# Altium schematic sheet Interface_Debug.SchDoc: Interface - USB-C and SWD Debug
size A3; ApprovedBy: Weymen Koo; CheckedBy: -; DrawnBy: Weymen Koo; DocumentNumber: UBCAD-FCSOM-SCH; Revision: A; SheetNumber: 15; SheetTotal: 18; ProjectTitle: Flight Controller SoM; Status: PRELIMINARY; ReleaseDate: 2026-11-14
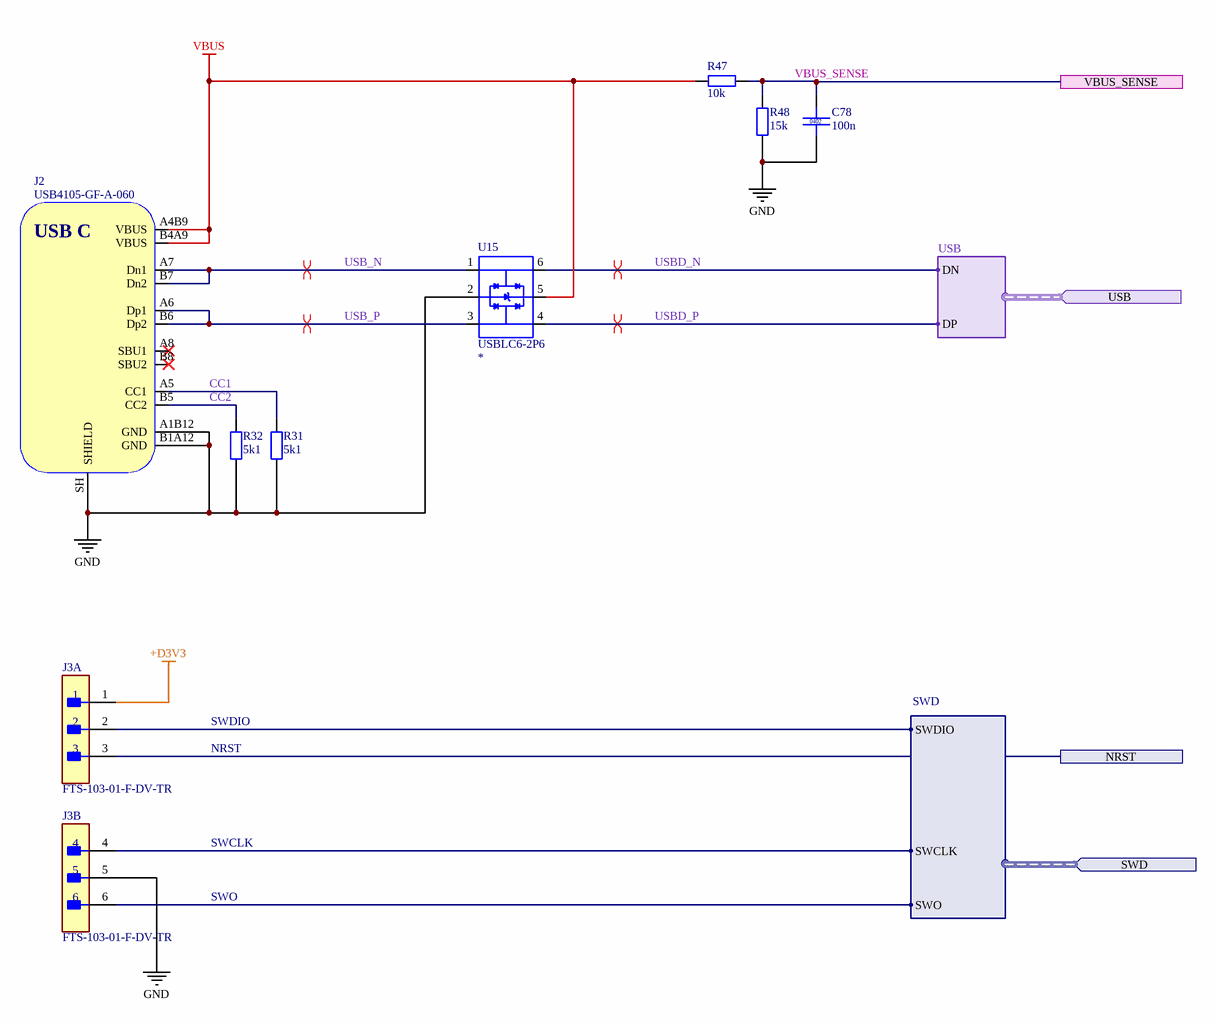
[diagram p0: Interface_Debug.SchDoc]

## Parts
C78  100n  [CAPC1005X05N]
J2  USB4105-GF-A-060  [USB4105-GF-A-060]
J3  FTS-103-01-F-DV-TR  [FP-FTS-103-01-F-DV-TR-MFG]  (parts A,B of 2)
R31  5k1  [IPC C R0402 NO SILK]
R32  5k1  [IPC C R0402 NO SILK]
R47  10k  [IPC C R0402 NO SILK]
R48  15k  [IPC C R0402 NO SILK]
U15  USBLC6-2P6  [SOT50P160X60-6N]

## Ports
NRST (see 1[4A], 3[7C], 17[5A]), SWD (in, harness SWD, see 1[4A], 4[9C]), USB (in, harness USB, see 1[4A], 4[9C]), VBUS_SENSE (see 1[3A], 4[9C])

## Harnesses
SWD: SWO, SWDIO, SWCLK
USB: DN, DP

## Nets
+D3V3: J3.1
GND: C78.2 J2.A1B12(GND) J2.B1A12(GND) J2.SH(SHIELD) J3.5 R31.2 R32.2 R48.2 U15.2(GND)
VBUS: J2.A4B9(VBUS) J2.B4A9(VBUS) R47.2 U15.5(VBUS)
CC1: J2.A5(CC1) R31.1
CC2: J2.B5(CC2) R32.1
NRST: J3.3 ; port NRST
SWCLK: J3.4 ; port SWD.SWCLK
SWDIO: J3.2 ; port SWD.SWDIO
SWO: J3.6 ; port SWD.SWO
USB_N: J2.A7(Dn1) J2.B7(Dn2) U15.1(I/O1_1)
USB_P: J2.A6(Dp1) J2.B6(Dp2) U15.3(I/O2_1)
USBD_N: U15.6(I/O1_2) ; port USB.DN
USBD_P: U15.4(I/O2_2) ; port USB.DP
VBUS_SENSE: C78.1 R47.1 R48.1 ; port VBUS_SENSE

Not connected (* = marked no-connect by the designer): J2 A8(SBU1)* B8(SBU2)*

## Layout directives
differential pair: USB_N, USB_P, USBD_N, USBD_P

## Notes on the sheet
- PROJECT
- KEY
- POWER
- 5 V class
- 3.3 V class
- Core / SMPS
- GND
- SHEET TITLE
- SIGNALS
- NOTES
- SPI
- Analog
- Design
- I2C
- PWM/Timer
- Layout
- UART/RC
- GPIO/Ctrl
- Assembly
- CAN
- Unused pin
- Firmware
- USB/SD/Clk
- Critical
- DRAWN
- DOCUMENT NO.
- CHECKED
- REV
- STATUS
- APPROVED
- DATE
- FILE
- SIZE
- A3
- SHEET
- of
- (in symbol CMP-164-000056-1) USB C

## Library data of the parts
C78 = CMP-002-000094-5: CAP 100n 16V X7R 10% 0402; Manufacturer: Samsung; Manufacturer Part Number: CL05B104KO5NNNC; Value: 100n; Tolerance: 10%; Package: 0402; Voltage: 16V; Dielectric: X7R; LCSC Part #: C1525
J2 = CMP-164-000056-1: USB Connector Type C SMT 12 Pin; Manufacturer: GCT; Distributor Link: https://eu.mouser.com/ProductDetail/GCT/USB4105-GF-A-060?qs=QNEnbhJQKvY2mocwNJzgfA%3D%3D; Manufacturer Part Number: USB4105-GF-A-060; Source: Schematic-Lib-PhilsLab.SchLib; Design Item ID: USB4105-GF-A-060
J3 = CMP-02761-000121-1: CONN HEADER SMD 6POS 1.27MM; Gender: Male; Number of Contacts: 6; Housing Material: Polymer; Radiation Hardening: No; Packaging: Tape and Reel; Termination: Solder; Min Operating Temperature: -55°C; Depth: 3.42mm; Length: 3.81mm; Orientation: Straight; Contact Plating: Gold; Contact Material: Bronze; RoHS Compliant: Yes; Housing Color: Black; REACH SVHC: No SVHC; Pitch: 1.27mm; Number of Rows: 2; Max Operating Temperature: 125°C
R31 R32 = CMP-008-000000-2: RES 5k1 1% 1/16W 0402; Manufacturer: UNI-ROYAL; Manufacturer Part Number: 0402WGF5101TCE; Value: 5k1; Source: Schlib1.SchLib; Design Item ID: Generic RES 0402; Package: 0402; Tolerance: 1%; Power: 1/16W; LCSC Part #: C25905
R47 = CMP-008-000000-2: RES 10k 1% 1/16W 0402; Manufacturer: UNI-ROYAL; Manufacturer Part Number: 0402WGF1002TCE; Value: 10k; Source: Schlib1.SchLib; Design Item ID: Generic RES 0402; Package: 0402; Tolerance: 1%; Power: 1/16W; LCSC Part #: C25744
R48 = CMP-008-000000-2: RES 15k 1% 1/16W 0402; Manufacturer: UNI-ROYAL; Manufacturer Part Number: 0402WGF1502TCE; Value: 15k; Source: Schlib1.SchLib; Design Item ID: Generic RES 0402; Package: 0402; Tolerance: 1%; Power: 1/16W; LCSC Part #: C25756
U15 = CMP-006-000005-3: ESD protection, 2 data lines and VBUS, SOT-666; MF: STMicroelectronics; MP: USBLC6-2P6; Source: SnapEDAsch.SchLib; Value: *; Availability: Unavailable; SnapEDA_Link: https://www.snapeda.com/parts/USBLC6-2P6/STMicroelectronics/view-part/106846/?ref=snap; Pin Count: 6; Design Item ID: USBLC6-2P6; Price: None; Package: SOT-563 STMicroelectronics; Component Type: Standard